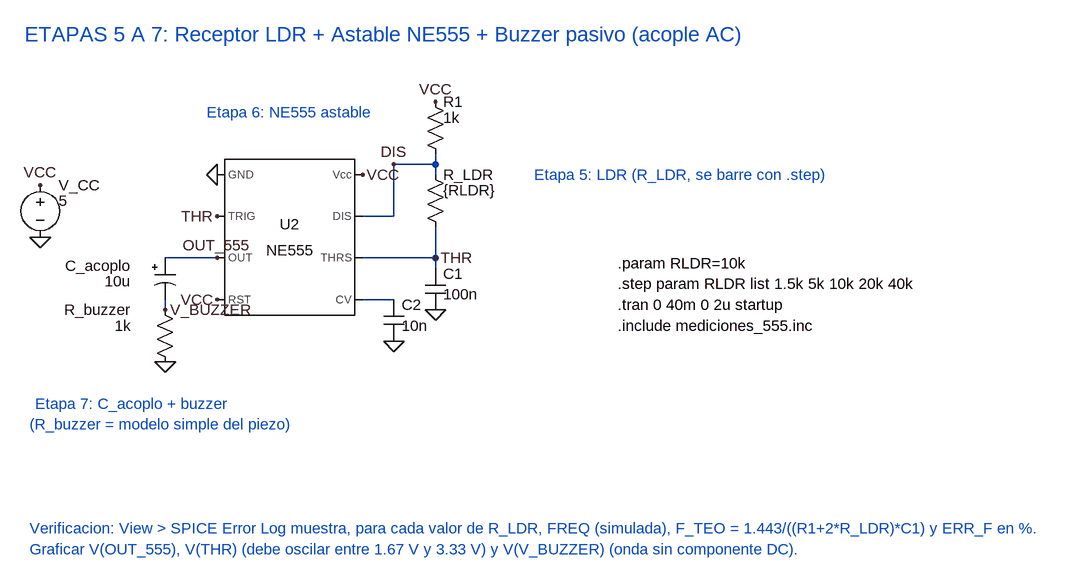
[diagram p0: schematic receptor_555_ldr.asc]
receptor_555_ldr.asc, the LTspice schematic file:
Version 4.1
SHEET 1 1752 900
WIRE 704 128 704 112
WIRE 704 128 640 128
WIRE 704 144 704 128
WIRE 640 208 640 128
WIRE 640 208 592 208
WIRE 368 272 288 272
WIRE 704 272 704 224
WIRE 704 272 592 272
WIRE 704 288 704 272
WIRE 640 336 592 336
WIRE 288 352 288 336
FLAG 96 160 VCC
FLAG 96 240 0
FLAG 368 144 0
FLAG 368 208 THR
FLAG 368 272 OUT_555
FLAG 368 336 VCC
FLAG 592 144 VCC
FLAG 704 32 VCC
FLAG 640 128 DIS
FLAG 704 272 THR
FLAG 704 352 0
FLAG 640 400 0
FLAG 288 352 V_BUZZER
FLAG 288 432 0
SYMBOL voltage 96 144 R0
WINDOW 0 28 16 Left 2
WINDOW 3 28 40 Left 2
SYMATTR InstName V_CC
SYMATTR Value 5
SYMBOL Misc\\NE555 480 240 R0
SYMATTR InstName U2
SYMBOL res 688 16 R0
WINDOW 0 28 16 Left 2
WINDOW 3 28 40 Left 2
SYMATTR InstName R1
SYMATTR Value 1k
SYMBOL res 688 128 R0
WINDOW 0 28 16 Left 2
WINDOW 3 28 40 Left 2
SYMATTR InstName R_LDR
SYMATTR Value {RLDR}
SYMBOL cap 688 288 R0
WINDOW 0 28 8 Left 2
WINDOW 3 28 40 Left 2
SYMATTR InstName C1
SYMATTR Value 100n
SYMBOL cap 624 336 R0
WINDOW 0 28 8 Left 2
WINDOW 3 28 40 Left 2
SYMATTR InstName C2
SYMATTR Value 10n
SYMBOL polcap 272 272 R0
WINDOW 0 -36 12 Right 2
WINDOW 3 -36 36 Right 2
SYMATTR InstName C_acoplo
SYMATTR Value 10u
SYMBOL res 272 336 R0
WINDOW 0 -36 16 Right 2
WINDOW 3 -36 40 Right 2
SYMATTR InstName R_buzzer
SYMATTR Value 1k
TEXT 72 -72 Left 3 ;ETAPAS 5 A 7: Receptor LDR + Astable NE555 + Buzzer pasivo (acople AC)
TEXT 856 144 Left 2 ;Etapa 5: LDR (R_LDR, se barre con .step)
TEXT 352 48 Left 2 ;Etapa 6: NE555 astable
TEXT 88 496 Left 2 ;Etapa 7: C_acoplo + buzzer
TEXT 80 528 Left 2 ;(R_buzzer = modelo simple del piezo)
TEXT 984 280 Left 2 !.param RLDR=10k
TEXT 984 312 Left 2 !.step param RLDR list 1.5k 5k 10k 20k 40k
TEXT 984 344 Left 2 !.tran 0 40m 0 2u startup
TEXT 984 376 Left 2 !.include mediciones_555.inc
TEXT 80 688 Left 2 ;Verificacion: View > SPICE Error Log muestra, para cada valor de R_LDR, FREQ (simulada), F_TEO = 1.443/((R1+2*R_LDR)*C1) y ERR_F en %.
TEXT 80 720 Left 2 ;Graficar V(OUT_555), V(THR) (debe oscilar entre 1.67 V y 3.33 V) y V(V_BUZZER) (onda sin componente DC).

The netlist it stands for:
* receptor_555_ldr.asc
V_CC VCC 0 5
X§U2 0 THR OUT_555 VCC N001 THR DIS VCC NE555  ; pins GND TRIG OUT RST CV THRS DIS Vcc
R1 VCC DIS 1k
R_LDR DIS THR {RLDR}
C1 THR 0 100n
C2 N001 0 10n
C_acoplo OUT_555 V_BUZZER 10u
R_buzzer V_BUZZER 0 1k
* ETAPAS 5 A 7: Receptor LDR + Astable NE555 + Buzzer pasivo (acople AC)
* Etapa 5: LDR (R_LDR, se barre con .step)
* Etapa 6: NE555 astable
* Etapa 7: C_acoplo + buzzer
* (R_buzzer = modelo simple del piezo)
.param RLDR=10k
.step param RLDR list 1.5k 5k 10k 20k 40k
.tran 0 40m 0 2u startup
.include mediciones_555.inc
* Verificacion: View > SPICE Error Log muestra, para cada valor de R_LDR, FREQ (simulada), F_TEO = 1.443/((R1+2*R_LDR)*C1) y ERR_F en %.
* Graficar V(OUT_555), V(THR) (debe oscilar entre 1.67 V y 3.33 V) y V(V_BUZZER) (onda sin componente DC).
.lib NE555.sub
.backanno
.end